# Altium project RECPT_POGO-JST.PrjPcb
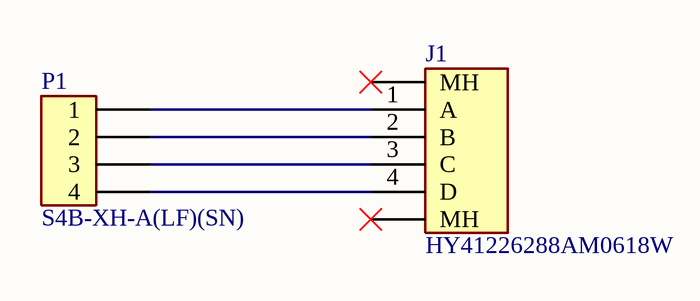
[diagram p0: Sch01.SchDoc]
1 sheet, 2 parts. Net scope: global (net labels, ports and power ports of the same name join across sheets).
Board file: PCB01.PcbDoc

## Sheet Sch01.SchDoc
size A4; SheetNumber: 1; SheetTotal: 1

### Parts
J1  HY41226288AM0618W  [HY41226288AM0618W]
P1  S4B-XH-A(LF)(SN)  [JST_S4B-XH-A(LF)(SN)]

### Nets
NetJ1_1: J1.1(A) P1.1
NetJ1_2: J1.2(B) P1.2
NetJ1_3: J1.3(C) P1.3
NetJ1_4: J1.4(D) P1.4

Not connected (* = marked no-connect by the designer): J1 MH*

### Notes on the sheet
- File:
- Title:
- Date:
- Page
- Num:
- Total:
- Drawn By: Huzaifa Ali

### Library data of the parts
J1 = HY41226288AM0618W: POGO RECPT 5-48V/3A
P1 = S4B-XH-A(LF)(SN): Conn Shrouded Header (4 Sides) HDR 4 POS 2.5mm Solder RA Side Entry Thru-Hole Box; MF: J.S.T. Manufacturing Co; SnapEDA_Link: https://www.snapeda.com/parts/S4B-XH-A(LF)(SN)/ACT/view-part/?ref=snap; MP: S4B-XH-A(LF)(SN); Availability: In Stock; Price: None; Value: *; Check_prices: https://www.snapeda.com/parts/S4B-XH-A(LF)(SN)/ACT/view-part/?ref=eda; Package: None